# Altium schematic sheet 30_TIME_GNSS.SchDoc
size 297 x 209 mm
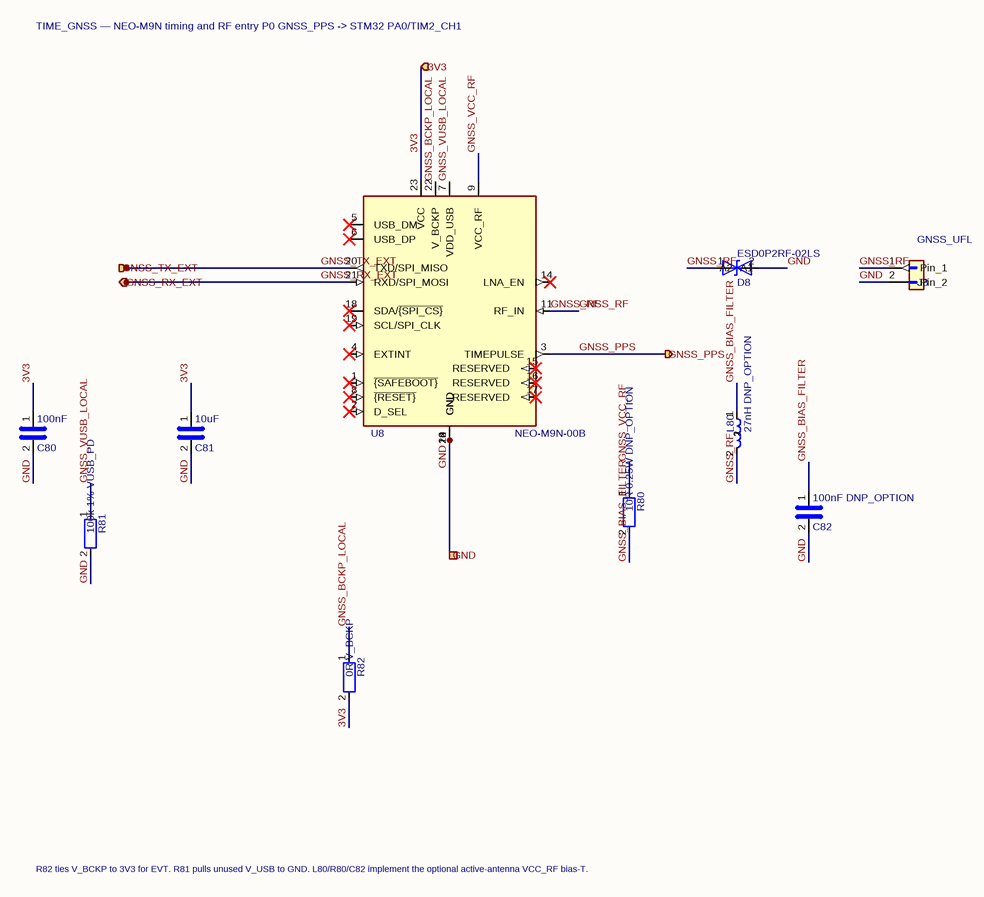
[diagram p0: 30_TIME_GNSS.SchDoc]

## Parts
C80  100nF  [C_0402_1005Metric]
C81  10uF  [C_0805_2012Metric]
C82  100nF DNP_OPTION  [C_0402_1005Metric]
D8  ESD0P2RF-02LS  [ESD0P2RF-02LS_PG-TSSLP-2-1]
J8  GNSS_UFL  [Hirose_UFL_R_SMT_K]
L80  27nH DNP_OPTION  [L_0402_1005Metric]
R80  10R 0.25W DNP_OPTION  [R_0805_2012Metric]
R81  100k 1% VUSB_PD  [R_0603_1608Metric]
R82  0R V_BCKP  [R_0603_1608Metric]
U8  NEO-M9N-00B  [NEO-M9N_LCC24_12.2x16mm]

## Ports
3V3 (in), GND, GNSS_PPS (out), GNSS_RX_EXT (in), GNSS_TX_EXT (out)

## Nets
3V3: C80.1 C81.1 R82.2 U8.23(VCC) ; port 3V3
GND: C80.2 C81.2 C82.2 D8.2(A2) J8.2(Pin_2) R81.2 U8.10(GND) U8.12(GND) U8.13(GND) U8.24(GND) ; port GND
GNSS_BCKP_LOCAL: R82.1 U8.22(V_BCKP)
GNSS_BIAS_FILTER: C82.1 L80.1 R80.2
GNSS_PPS: U8.3(TIMEPULSE) ; port GNSS_PPS
GNSS_RF: D8.1(A1) J8.1(Pin_1) L80.2 U8.11(RF_IN)
GNSS_RX_EXT: U8.21(RXD/SPI_MOSI) ; port GNSS_RX_EXT
GNSS_TX_EXT: U8.20(TXD/SPI_MISO) ; port GNSS_TX_EXT
GNSS_VCC_RF: R80.1 U8.9(VCC_RF)
GNSS_VUSB_LOCAL: R81.1 U8.7(VDD_USB)

Not connected (* = marked no-connect by the designer): U8 1(~{{SAFEBOOT}})* 2(D_SEL)* 4(EXTINT)* 5(USB_DM)* 6(USB_DP)* 8(~{{RESET}})* 14(LNA_EN)* 15(RESERVED)* 16(RESERVED)* 17(RESERVED)* 18(SDA/~{{SPI_CS}})* 19(SCL/SPI_CLK)*

## Notes on the sheet
- TIME_GNSS — NEO-M9N timing and RF entry
  P0 GNSS_PPS -> STM32 PA0/TIM2_CH1
- R82 ties V_BCKP to 3V3 for EVT. R81 pulls unused V_USB to GND.
  L80/R80/C82 implement the optional active-antenna VCC_RF bias-T.
- 1
- 2
- 3
- 4
- 5
- 6
- A
- B
- C
- D
- Title: EVT_SYS_CARRIER
- File: 30_TIME_GNSS.kicad_sch
- Sheet: /
- KiCad E.D.A.  kicad (5.1.4)-1
- Size: A4
- Date:
- Rev:
- Id: 1/1

## Library data of the parts
C80 C82 = C: MPN: 100nF_16V_X7R; hierarchy_path: /e9734d24-1147-48a4-8c35-43c2d94a380c/8bfddfcd-0489-4b1c-8323-9ba013a4e52f; Footprint: Capacitor_SMD:C_0402_1005Metric
  C80: Value: 100nF
  C82: Value: 100nF DNP_OPTION
C81 = C: MPN: 10uF_6.3V_X7R; hierarchy_path: /e9734d24-1147-48a4-8c35-43c2d94a380c/8bfddfcd-0489-4b1c-8323-9ba013a4e52f; Value: 10uF; Footprint: Capacitor_SMD:C_0805_2012Metric
D8 = D_TVS: hierarchy_path: /e9734d24-1147-48a4-8c35-43c2d94a380c/8bfddfcd-0489-4b1c-8323-9ba013a4e52f; MPN: ESD0P2RF-02LS; Value: ESD0P2RF-02LS; Footprint: SystemCarrier_Local:ESD0P2RF-02LS_PG-TSSLP-2-1
J8 = Conn_01x02: MPN: U.FL-R-SMT-K(800); hierarchy_path: /e9734d24-1147-48a4-8c35-43c2d94a380c/8bfddfcd-0489-4b1c-8323-9ba013a4e52f; Value: GNSS_UFL; Footprint: SystemCarrier_Altium:Hirose_UFL_R_SMT_K
L80 = L: MPN: 27nH_0402; hierarchy_path: /e9734d24-1147-48a4-8c35-43c2d94a380c/8bfddfcd-0489-4b1c-8323-9ba013a4e52f; Value: 27nH DNP_OPTION; Footprint: Inductor_SMD:L_0402_1005Metric
R80 = R: MPN: 10R_0.25W; hierarchy_path: /e9734d24-1147-48a4-8c35-43c2d94a380c/8bfddfcd-0489-4b1c-8323-9ba013a4e52f; Value: 10R 0.25W DNP_OPTION; Footprint: Resistor_SMD:R_0805_2012Metric
R81 = R: MPN: 100k_1%; hierarchy_path: /e9734d24-1147-48a4-8c35-43c2d94a380c/8bfddfcd-0489-4b1c-8323-9ba013a4e52f; Value: 100k 1% VUSB_PD; Footprint: Resistor_SMD:R_0603_1608Metric
R82 = R: hierarchy_path: /e9734d24-1147-48a4-8c35-43c2d94a380c/8bfddfcd-0489-4b1c-8323-9ba013a4e52f; MPN: 0R; Value: 0R V_BCKP; Footprint: Resistor_SMD:R_0603_1608Metric
U8 = NEO-M9N: hierarchy_path: /e9734d24-1147-48a4-8c35-43c2d94a380c/8bfddfcd-0489-4b1c-8323-9ba013a4e52f; MPN: NEO-M9N-00B; Value: NEO-M9N-00B; Footprint: SystemCarrier_Local:NEO-M9N_LCC24_12.2x16mm